# Altium schematic sheet nrf52mini.SchDoc
size A3; SheetNumber: 1; SheetTotal: 1
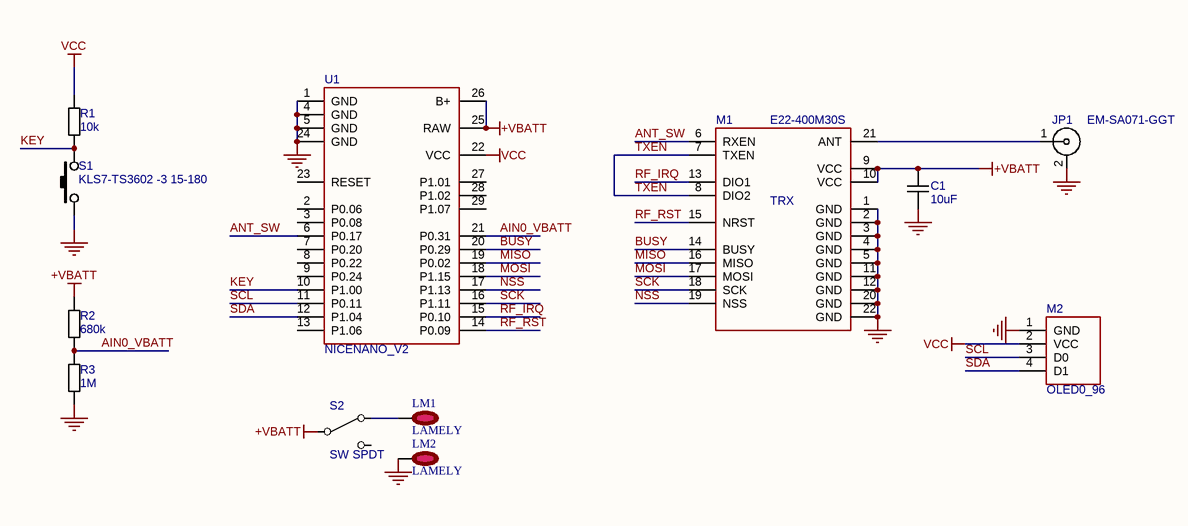
[diagram p0: nrf52mini.SchDoc]

## Parts
C1  10uF  [C-0805]
JP1  EM-SA071-GGT  [SMA_F_EDGE]
LM1  LAMELY  [LM2X10]  (no BOM)
LM2  LAMELY  [LM2X10]  (no BOM)
M1  E22-400M30S  [PE22(400M30S)]
M2  OLED0_96  [OLED096_I2C]
R1  10k  [R-0603]
R2  680k  [R-0603]
R3  1M  [R-0603]
S1  KLS7-TS3602 -3 15-180  [BUTT_MIN]
S2  SW SPDT  [SK-12D07VG5]
U1  NICENANO_V2  [NICENANO_SMD]

## Nets
+VBATT: C1.1 M1.9(VCC) M1.10(VCC) R2.2 S2.2(COMMON) U1.25(RAW) U1.26(B+)
GND: C1.2 JP1.2 LM2.1(Lamely) M1.1(GND) M1.2(GND) M1.3(GND) M1.4(GND) M1.5(GND) M1.11(GND) M1.12(GND) M1.20(GND) M1.22(GND) M2.1(GND) R3.1 S1.1 U1.1(GND) U1.4(GND) U1.5(GND) U1.24(GND)
VCC: M2.2(VCC) R1.1 U1.22(VCC)
AIN0_VBATT: R2.1 R3.2 U1.21(P0.31)
ANT_SW: M1.6(RXEN) U1.6(P0.17)
BUSY: M1.14(BUSY) U1.20(P0.29)
KEY: R1.2 S1.2 U1.10(P1.00)
MISO: M1.16(MISO) U1.19(P0.02)
MOSI: M1.17(MOSI) U1.18(P1.15)
NSS: M1.19(NSS) U1.17(P1.13)
RF_IRQ: M1.13(DIO1) U1.15(P0.10)
RF_RST: M1.15(NRST) U1.14(P0.09)
SCK: M1.18(SCK) U1.16(P1.11)
SCL: M2.3(D0) U1.11(P0.11)
SDA: M2.4(D1) U1.12(P1.04)
TXEN: M1.7(TXEN) M1.8(DIO2)
NetJP1_1: JP1.1 M1.21(ANT)
NetLM1_1: LM1.1(Lamely) S2.1(NC)

Not connected (* = marked no-connect by the designer): S2 3(NO); U1 2(P0.06) 3(P0.08) 7(P0.20) 8(P0.22) 9(P0.24) 13(P1.06) 23(RESET) 27(P1.01) 28(P1.02) 29(P1.07)

## Notes on the sheet
- (in symbol E22) TRX

## Library data of the parts
C1 = CAPN: Voltage: 50V; Точність/група: NP0; Вид: Конденсатор
JP1 = SMA: SMA Female R/A PCB Mount; Вид: Роз'єм
LM1 LM2 = LAMELY: Вид: Роз'єм; *: *
M1 = E22
M2 = OLED0_96_I2C
R1-R3 = RES: Точність/група: 5%; Вид: Резистор
S1 = SW-1: Вид: Кнопка; Робоча напруга: *
S2 = SW SPDT: Вид: Перемикач; Виробник: *; *: *
U1 = NICENANO_V2: Вид: Мікросхема